# EAGLE design cpu2-a (EAGLE 9.7.0)
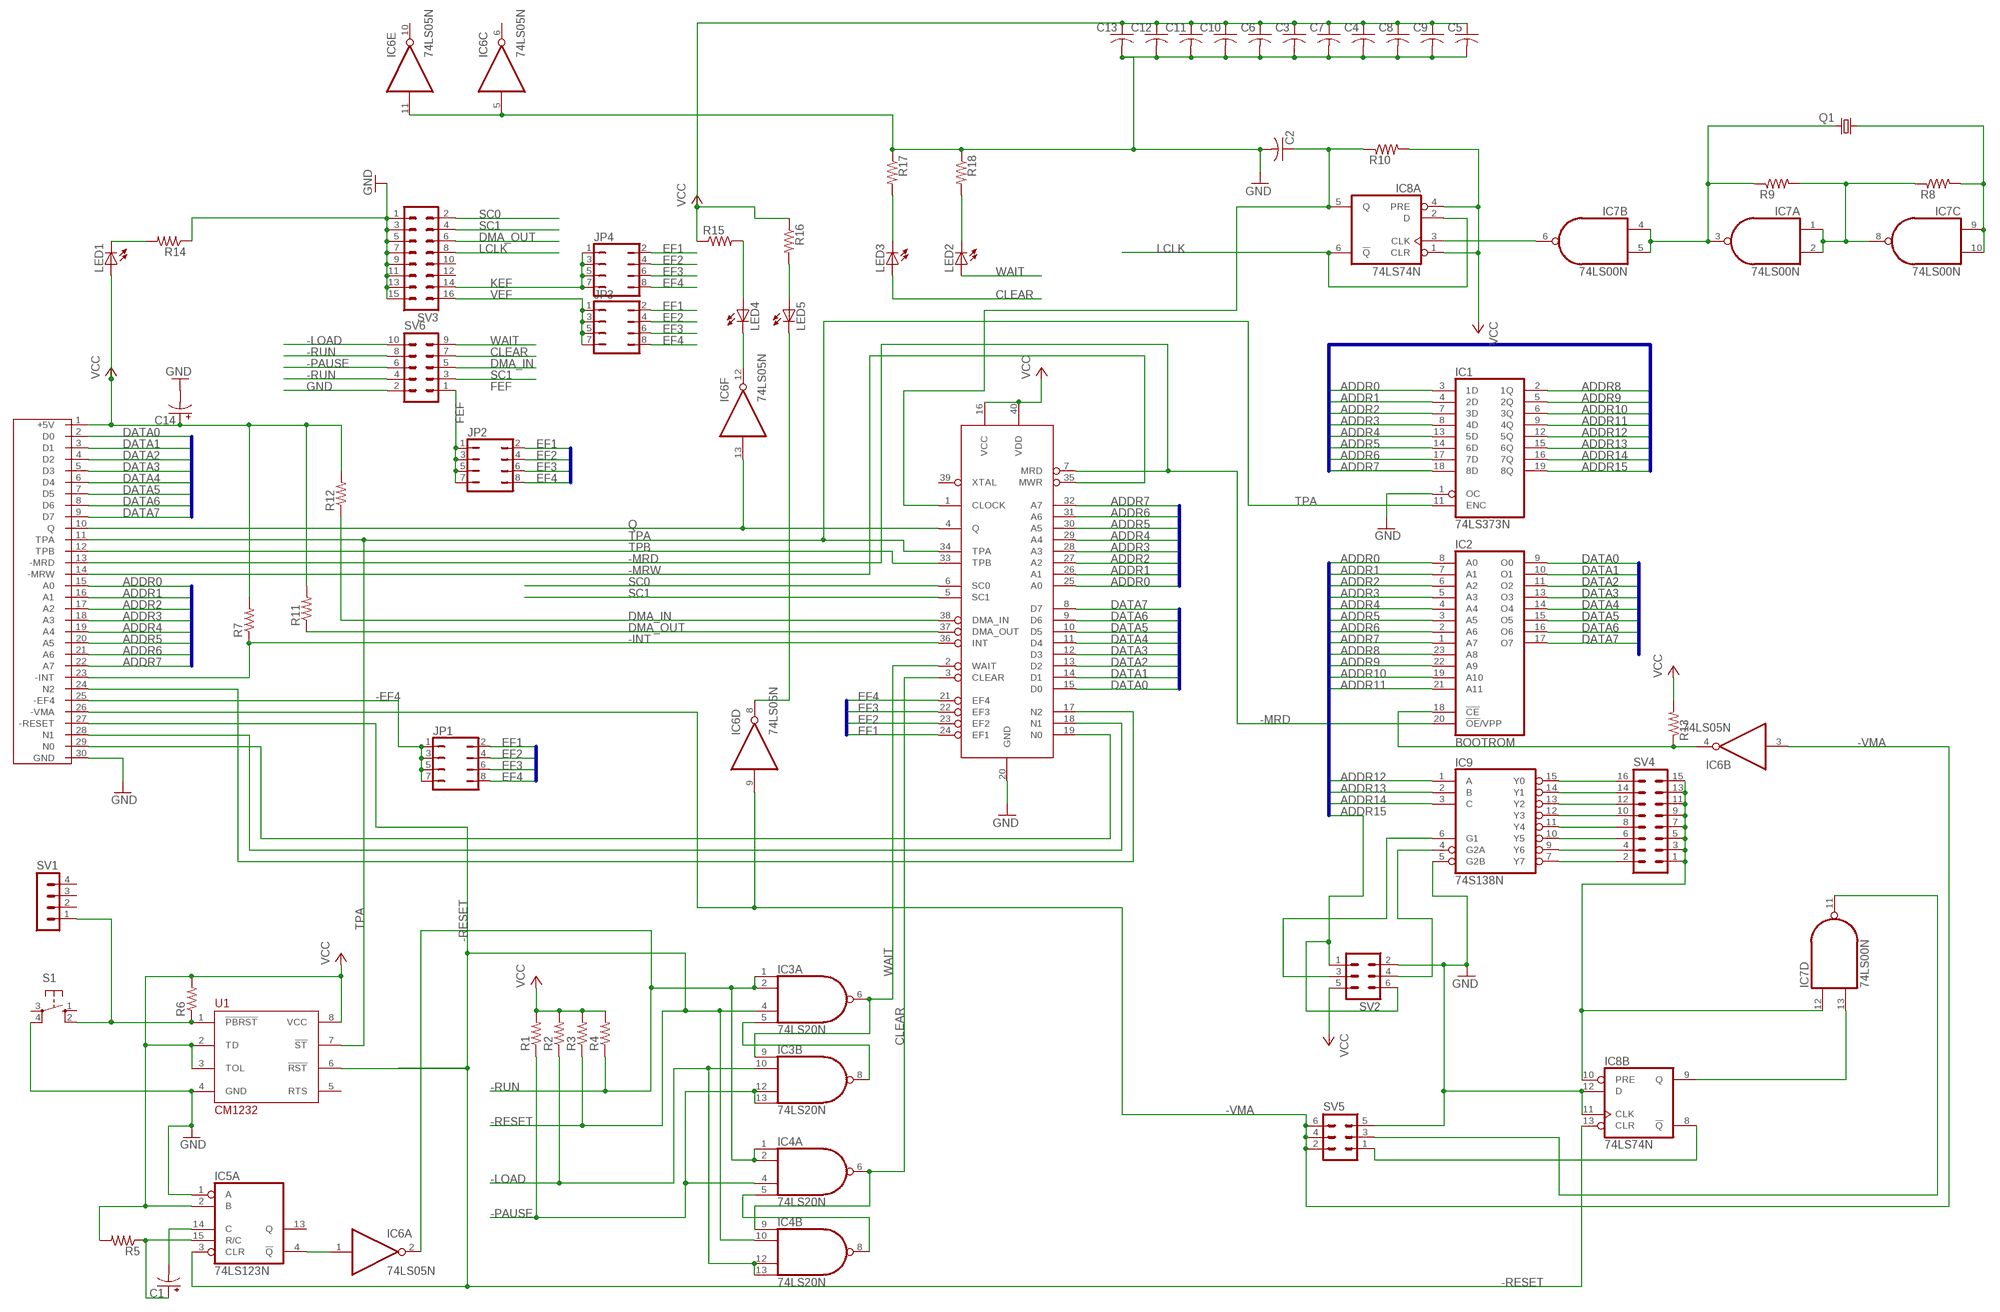
[diagram p0: schematic, sheet 1]

## Parts
C1  CPOL-USE2.5-7  [E2,5-7]
C2  C-US025-025X050  [C025-025X050]
C3  C-US025-050X050  [C025-050X050]
C4  C-US025-050X050  [C025-050X050]
C5  C-US025-050X050  [C025-050X050]
C6  C-US025-050X050  [C025-050X050]
C7  C-US025-050X050  [C025-050X050]
C8  C-US025-050X050  [C025-050X050]
C9  C-US025-050X050  [C025-050X050]
C10  C-US025-050X050  [C025-050X050]
C11  C-US025-050X050  [C025-050X050]
C12  C-US025-050X050  [C025-050X050]
C13  C-US025-050X050  [C025-050X050]
C14  CPOL-USE2.5-7  [E2,5-7]
IC1  74LS373N  [DIL20]
IC2  BOOTROM  2732  [DIL24]
IC3  74LS20N  [DIL14]
IC4  74LS20N  [DIL14]
IC5  74LS123N  [DIL16]
IC6  74LS05N  [DIL14]
IC7  74LS00N  [DIL14]
IC8  74LS74N  [DIL14]
IC9  74S138N  [DIL16]
JP1  JP4Q  [JP4Q]
JP2  JP4Q  [JP4Q]
JP3  JP4Q  [JP4Q]
JP4  JP4Q  [JP4Q]
LED1  LED5MM  [LED5MM]
LED2  LED5MM  [LED5MM]
LED3  LED5MM  [LED5MM]
LED4  LED5MM  [LED5MM]
LED5  LED5MM  [LED5MM]
Q1  CRYTALHC49U70  [HC49U70]
R1  R-US_0207/2V  [0207/2V]
R2  R-US_0207/2V  [0207/2V]
R3  R-US_0207/2V  [0207/2V]
R4  R-US_0207/2V  [0207/2V]
R5  R-US_0207/2V  [0207/2V]
R6  R-US_0207/2V  [0207/2V]
R7  R-US_0207/2V  [0207/2V]
R8  R-US_0207/2V  [0207/2V]
R9  R-US_0207/2V  [0207/2V]
R10  R-US_0207/2V  [0207/2V]
R11  R-US_0207/2V  [0207/2V]
R12  R-US_0207/2V  [0207/2V]
R13  R-US_0207/2V  [0207/2V]
R14  R-US_0207/7  [0207/7]
R15  R-US_0207/7  [0207/7]
R16  R-US_0207/7  [0207/7]
R17  R-US_0207/7  [0207/7]
R18  R-US_0207/7  [0207/7]
S1  10-XX  [B3F-10XX]
SV1  MA04-1  [MA04-1]
SV2  MA03-2  [MA03-2]
SV3  MA08-2  [MA08-2]
SV4  MA08-2  [MA08-2]
SV5  MA03-2  [MA03-2]
SV6  MA05-2  [MA05-2]
U1  CM1232  [DIP-8]
U$1  CDP1802BCECDP1802BCE  [DIL40]
U$2  C30  [C30]

## Nets
-EF4: JP1.1 JP1.3 JP1.5 JP1.7 U$2.25(-EF4)
-INT: R7.1 U$1.36(INT) U$2.23(-INT)
-LOAD: IC3.10(B:I1) IC4.12(B:I2) IC4.13(B:I3) R2.1 SV6.10
-MRD: IC2.20(!OE!/VPP) U$1.7(MRD) U$2.13(-MRD)
-MRW: U$1.35(MWR) U$2.14(-MRW)
-PAUSE: IC3.12(B:I2) IC3.13(B:I3) IC4.4(A:I2) R1.1 SV6.6
-RESET: IC3.4(A:I2) IC4.10(B:I1) IC5.3(A:CLR) IC8.13(B:CLR) R3.1 U1.6(!RST) U$2.27(-RESET)
-RUN: IC3.1(A:I0) IC3.2(A:I1) IC4.1(A:I0) IC4.2(A:I1) IC6.2(A:O) R4.1 SV6.4 SV6.8
-VMA: IC6.3(B:I) IC6.9(D:I) SV5.2 SV5.4 SV5.6 U$2.26(-VMA)
ADDR0: IC1.3(1D) IC2.8(A0) U$1.25(A0) U$2.15(A0)
ADDR1: IC1.4(2D) IC2.7(A1) U$1.26(A1) U$2.16(A1)
ADDR2: IC1.7(3D) IC2.6(A2) U$1.27(A2) U$2.17(A2)
ADDR3: IC1.8(4D) IC2.5(A3) U$1.28(A3) U$2.18(A3)
ADDR4: IC1.13(5D) IC2.4(A4) U$1.29(A4) U$2.19(A4)
ADDR5: IC1.14(6D) IC2.3(A5) U$1.30(A5) U$2.20(A5)
ADDR6: IC1.17(7D) IC2.2(A6) U$1.31(A6) U$2.21(A6)
ADDR7: IC1.18(8D) IC2.1(A7) U$1.32(A7) U$2.22(A7)
ADDR8: IC1.2(1Q) IC2.23(A8)
ADDR9: IC1.5(2Q) IC2.22(A9)
ADDR10: IC1.6(3Q) IC2.19(A10)
ADDR11: IC1.9(4Q) IC2.21(A11)
ADDR12: IC1.12(5Q) IC9.1(A)
ADDR13: IC1.15(6Q) IC9.2(B)
ADDR14: IC1.16(7Q) IC9.3(C)
ADDR15: IC1.19(8Q) SV2.1 SV2.6
CLEAR: IC4.6(A:O) IC4.9(B:I0) LED3.A SV6.7 U$1.3(CLEAR)
DATA0: IC2.9(O0) U$1.15(D0) U$2.2(D0)
DATA1: IC2.10(O1) U$1.14(D1) U$2.3(D1)
DATA2: IC2.11(O2) U$1.13(D2) U$2.4(D2)
DATA3: IC2.13(O3) U$1.12(D3) U$2.5(D3)
DATA4: IC2.14(O4) U$1.11(D4) U$2.6(D4)
DATA5: IC2.15(O5) U$1.10(D5) U$2.7(D5)
DATA6: IC2.16(O6) U$1.9(D6) U$2.8(D6)
DATA7: IC2.17(O7) U$1.8(D7) U$2.9(D7)
DMA_IN: R12.1 SV6.5 U$1.38(DMA_IN)
DMA_OUT: R11.1 SV3.6 U$1.37(DMA_OUT)
EF1: JP1.2 JP2.2 JP3.2 JP4.2 U$1.24(EF1)
EF2: JP1.4 JP2.4 JP3.4 JP4.4 U$1.23(EF2)
EF3: JP1.6 JP2.6 JP3.6 JP4.6 U$1.22(EF3)
EF4: JP1.8 JP2.8 JP3.8 JP4.8 U$1.21(EF4)
FEF: JP2.1 JP2.3 JP2.5 JP2.7 SV6.1
GND: C2.2 C3.2 C4.2 C5.2 C6.2 C7.2 C8.2 C9.2 C10.2 C11.2 C12.2 C13.2 C14.- IC1.1(OC) IC5.1(A:A) IC6.5(C:I) IC6.11(E:I) IC8.11(B:CLK) IC8.12(B:D) IC9.5(G2B) R14.1 R17.1 R18.1 S1.4(P1) SV2.2 SV3.1 SV3.3 SV3.5 SV3.7 SV3.9 SV3.11 SV3.13 SV3.15 SV5.5 SV6.2 U1.4(GND) U$1.20(GND) U$2.30(GND)
KEF: JP4.1 JP4.3 JP4.5 JP4.7 SV3.14
LCLK: IC8.2(A:D) IC8.6(A:!Q) SV3.8
N0: U$1.19(N0) U$2.29(N0)
N1: U$1.18(N1) U$2.28(N1)
N2: U$1.17(N2) U$2.24(N2)
N$1: IC7.11(D:O) SV5.3
N$2: R6.1 S1.2(S1) SV1.1 U1.1(!PBRST)
N$3: IC2.18(!CE) IC6.4(B:O) R13.1
N$4: IC7.13(D:I1) IC8.9(B:Q)
N$5: LED1.K(C) R14.2
N$6: IC8.8(B:!Q) SV5.1
N$7: IC6.12(F:O) LED4.K(C)
N$8: LED4.A R15.2
N$9: LED3.K(C) R17.2
N$10: LED2.K(C) R18.2
N$13: LED5.A R16.2
N$15: IC5.4(A:!Q) IC6.1(A:I)
N$16: IC7.1(A:I0) IC7.2(A:I1) IC7.8(C:O) R8.1 R9.2
N$17: C1.+ IC5.15(A:R/C) R5.1
N$18: IC7.3(A:O) IC7.4(B:I0) IC7.5(B:I1) Q1.2 R9.1
N$19: C1.- IC5.14(A:C)
N$20: IC9.4(G2A) SV2.4
N$21: IC7.9(C:I0) IC7.10(C:I1) Q1.1 R8.2
N$22: IC3.5(A:I3) IC3.8(B:O)
N$23: IC7.6(B:O) IC8.3(A:CLK)
N$24: IC4.5(A:I3) IC4.8(B:O)
N$25: IC6.8(D:O) LED5.K(C)
N$27: C2.1 IC8.5(A:Q) R10.1 U$1.1(CLOCK)
N$29: IC9.15(Y0) SV4.16
N$30: IC9.14(Y1) SV4.14
N$31: IC9.13(Y2) SV4.12
N$32: IC9.12(Y3) SV4.10
N$33: IC9.11(Y4) SV4.8
N$34: IC9.10(Y5) SV4.6
N$35: IC9.9(Y6) SV4.4
N$36: IC9.7(Y7) SV4.2
N$37: IC7.12(D:I0) IC8.10(B:PRE) SV4.1 SV4.3 SV4.5 SV4.7 SV4.9 SV4.11 SV4.13 SV4.15
N$38: IC9.6(G1) SV2.3
Q: IC6.13(F:I) U$1.4(Q) U$2.10(Q)
SC0: SV3.2 U$1.6(SC0)
SC1: SV3.4 SV6.3 U$1.5(SC1)
TPA: IC1.11(ENC) U1.7(!ST) U$1.34(TPA) U$2.11(TPA)
TPB: U$1.33(TPB) U$2.12(TPB)
VCC: C3.1 C4.1 C5.1 C6.1 C7.1 C8.1 C9.1 C10.1 C11.1 C12.1 C13.1 C14.+ IC5.2(A:B) IC8.1(A:CLR) IC8.4(A:PRE) LED1.A R1.2 R2.2 R3.2 R4.2 R5.2 R6.2 R7.2 R10.2 R11.2 R12.2 R13.2 R15.1 R16.1 SV2.5 U1.2(TD) U1.3(TOL) U1.8(VCC) U$1.16(VCC) U$1.40(VDD) U$2.1(+5V)
VEF: JP3.1 JP3.3 JP3.5 JP3.7 SV3.16
WAIT: IC3.6(A:O) IC3.9(B:I0) LED2.A SV6.9 U$1.2(WAIT)
Unconnected: IC5.5(B:Q) IC5.6(B:C) IC5.7(B:R/C) IC5.9(B:A) IC5.10(B:B) IC5.11(B:CLR) IC5.12(B:!Q) IC5.13(A:Q) IC6.6(C:O) IC6.10(E:O) S1.1(S) S1.3(P) SV1.2 SV1.3 SV1.4 SV3.10 SV3.12 U1.5(RTS) U$1.39(XTAL)

## Buses
DATA[0..7]
ADDR[0..15]
EF[1..4]

## Power pins joined to a net without a drawn wire
GND: IC1.10(GND) IC2.12(GND) IC3.7(P:GND) IC4.7(P:GND) IC5.8(P:GND) IC6.7(P:GND) IC7.7(P:GND) IC8.7(P:GND) IC9.8(GND)
VCC: IC1.20(VCC) IC2.24(VCC) IC3.14(P:VCC) IC4.14(P:VCC) IC5.16(P:VCC) IC6.14(P:VCC) IC7.14(P:VCC) IC8.14(P:VCC) IC9.16(VCC)

## Library data of the parts
C1 C14 = rcl:CPOL-US: POLARIZED CAPACITOR, American symbol
C2-C13 = rcl:C-US: CAPACITOR, American symbol
IC1 = 74xx-us:74*373: Octal D type transparent LATCH, edge triggered
IC2 = memory:2732: MEMORY
IC3 IC4 = 74xx-us:74*20: Dual 4-input NAND gate
IC5 = 74xx-us:74*123: Retriggerable monostable MULTIVIBRATOR
IC6 = 74xx-us:74*05: Hex INVERTER, open collector
IC7 = 74xx-us:74*00: Quad 2-input NAND gate
IC8 = 74xx-us:74*74: Dual D type positive edge triggered FLIP FLOP, preset and clear
IC9 = 74xx-us:74*138: 3-line to 8-line DECODER/DEMULTIPLEXER
JP1-JP4 = jumper:JP4Q: JUMPER
LED1-LED5 = led:LED: LED OSRAM: - CHIPLED LG R971, LG N971, LY N971, LG Q971, LY Q971, LO R971, LY R971 LH N974, LH R974 LS Q976, LO Q976, LY Q976 LO Q996 - Hyper CHIPLED LW Q18S LB Q993, LB Q99A, LB R99A - SideLED LS A670, LO A670, LY A670, LG A670, LP A670 LB A673, LV A673, LT A673, LW A673 LH A674 LY A675 LS A676, LA A676, LO A676, LY A676, LW A676 LS A679, LY A679, LG A679 - Hyper Micro SIDELED® LS Y876, LA Y876, LO Y876, LY Y876 LT Y87S - SmartLED LW L88C, LW L88S LB L89C, LB L89S, LG L890 LS L89K, LO L89K, LY L89K LS L896, LA L896, LO L896, LY L896 - TOPLED LS T670, LO T670, LY T670, LG T670, LP T670 LSG T670, LSP T670, LSY T670, LOP T670, LYG T670 LG T671, LOG T671, LSG T671 LB T673, LV T673, LT T673, LW T673 LH T674 LS T676, LA T676, LO T676, LY T676, LB T676, LH T676, LSB T676, LW T676 LB T67C, LV T67C, LT T67C, LS T67K, LO T67K, LY T67K, LW E67C LS E67B, LA E67B, LO E67B, LY E67B, LB E67C, LV E67C, LT E67C LW T67C LS T679, LY T679, LG T679 LS T770, LO T770, LY T770, LG T770, LP T770 LB T773, LV T773, LT T773, LW T773 LH T774 LS E675, LA E675, LY E675, LS T675 LS T776, LA T776, LO T776, LY T776, LB T776 LHGB T686 LT T68C, LB T68C - Hyper Mini TOPLED® LB M676 - Mini TOPLED Santana® LG M470 LS M47K, LO M47K, LY M47K Source: http://www.osram.convergy.de/
Q1 = crystal:CRYTAL: CRYSTAL
R1-R18 = rcl:R-US_: RESISTOR, American symbol
S1 = switch-omron:10-XX: OMRON SWITCH
SV1 = con-lstb:MA04-1: PIN HEADER
SV2 SV5 = con-lstb:MA03-2: PIN HEADER
SV3 SV4 = con-lstb:MA08-2: PIN HEADER
SV6 = con-lstb:MA05-2: PIN HEADER
U1 = 65xxx:CM1232: CM1232 CMOS Microprocessor Monitor
U$1 = cdp:CDP1802BCE
U$2 = k1:C30

## Board
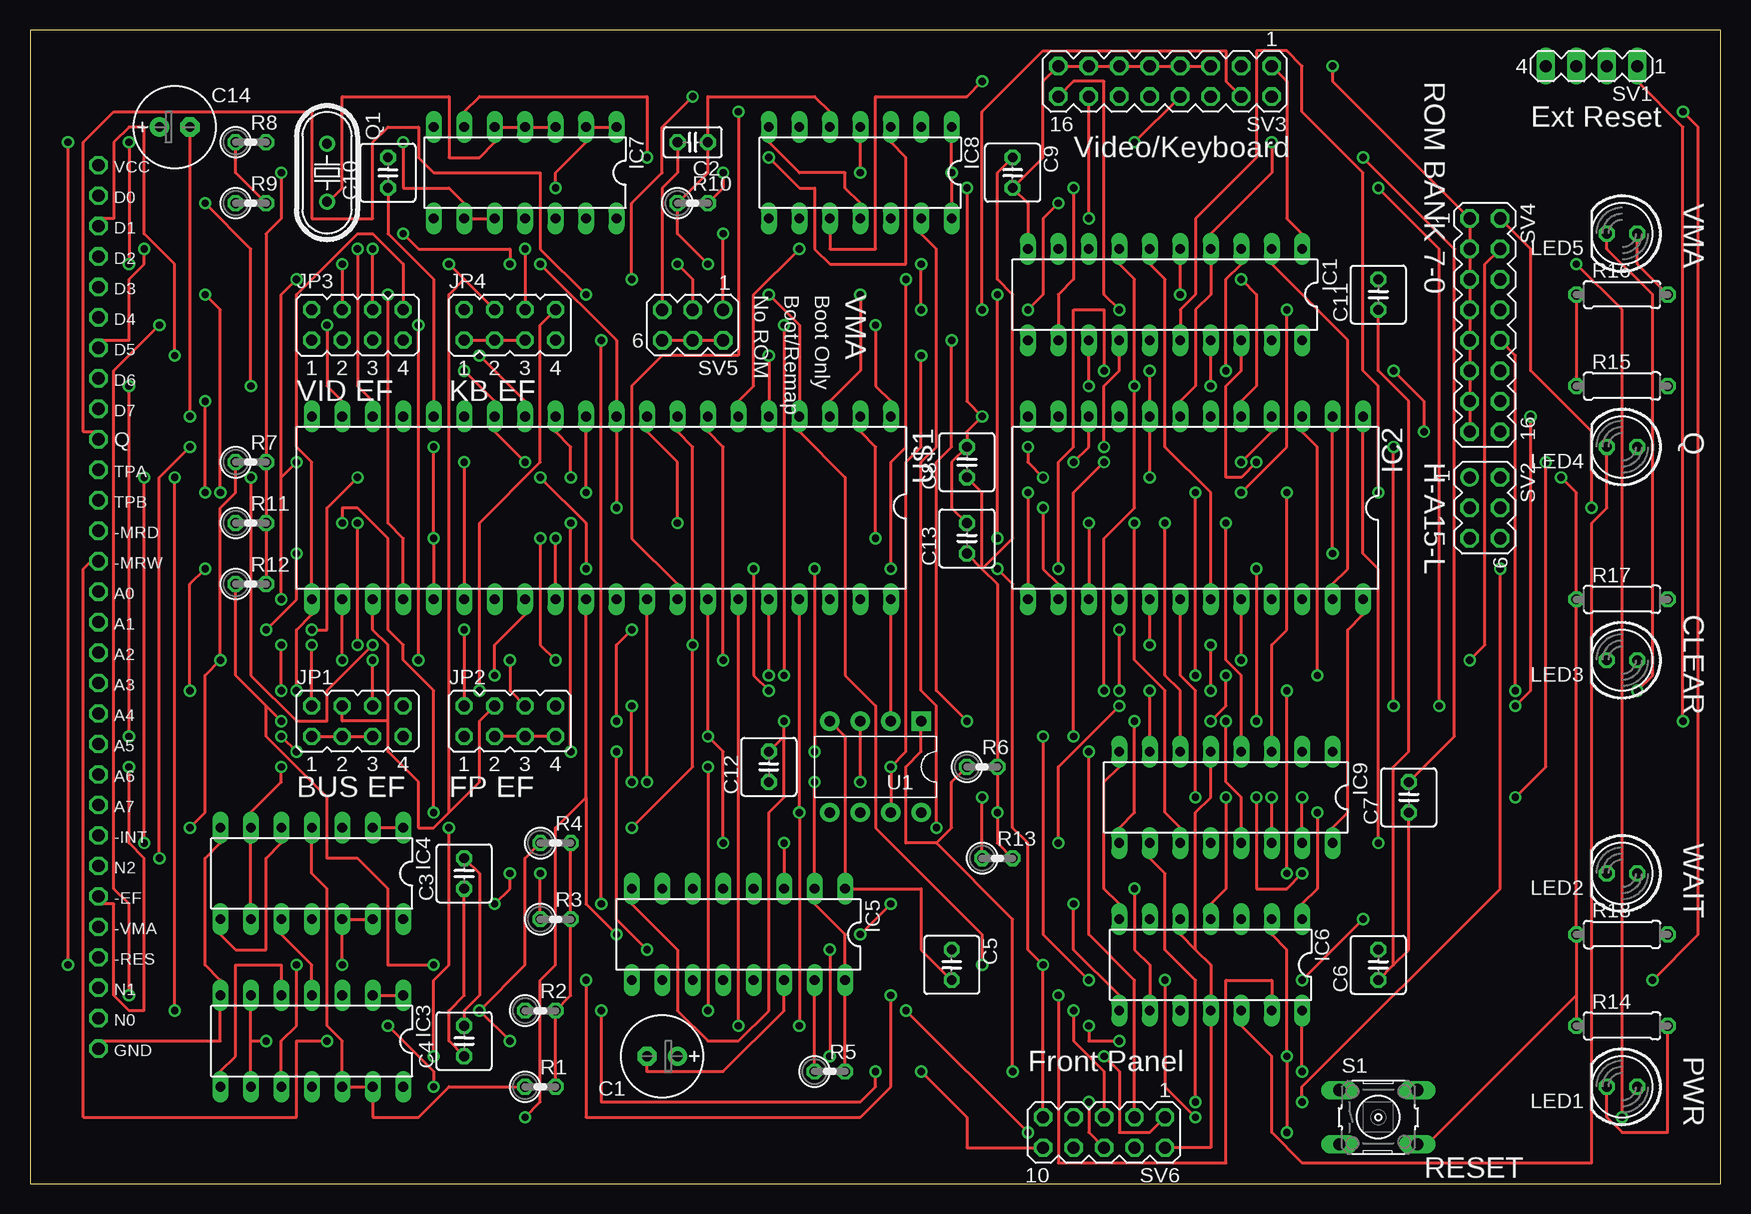
[diagram p1: board, top side]
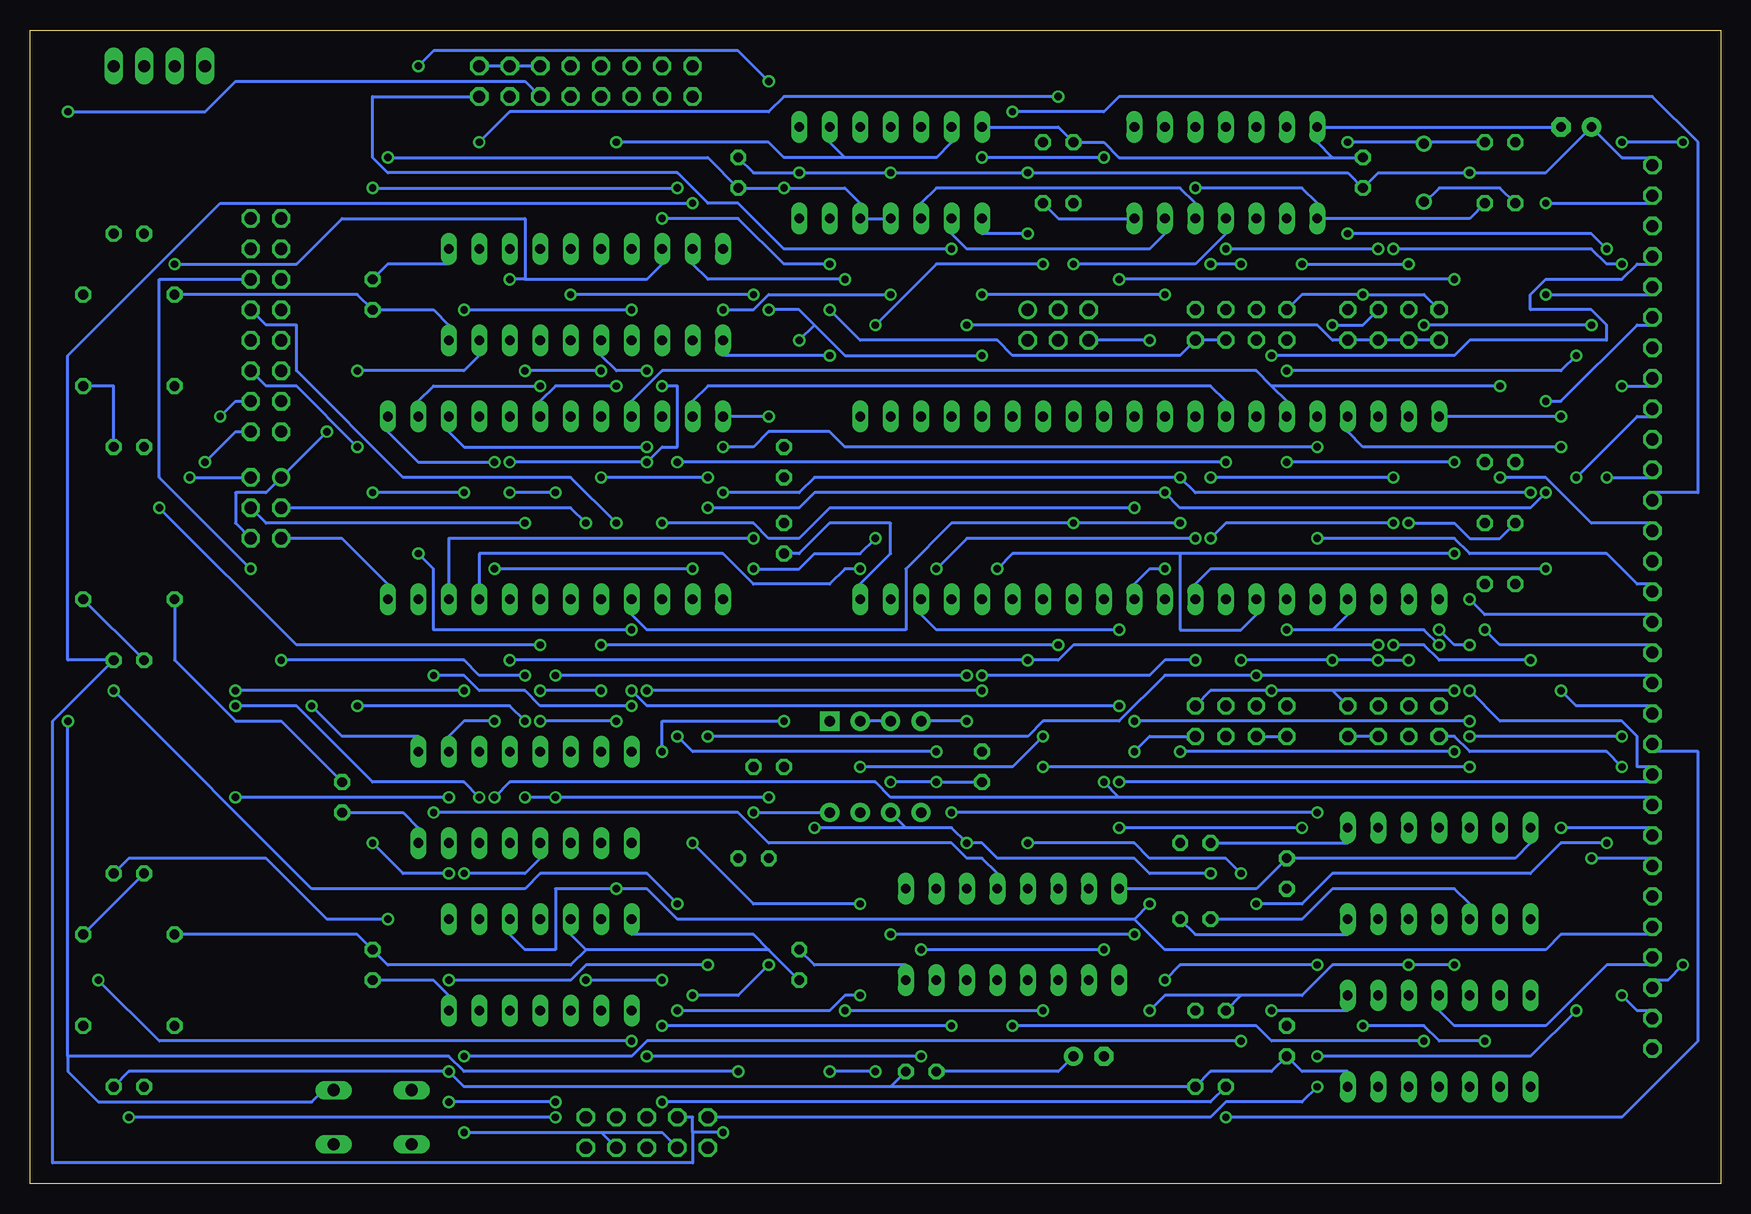
[diagram p2: board, bottom side, seen from below]

Size 140.95 x 96.19 mm. Coordinates in mm from the lower left corner, seen from the top.
Outline: 0,0 140.95,0 140.95,96.19 0,96.19 0,0
Copper layers (1*16): Top / Bottom
Stack-up Default Layer Stack: Top User Defined 0.035mm / Dielectric-1 User Defined 1.5mm / Bottom User Defined 0.035mm
Design rules: minimum drill size 24mil, minimum copper width 10mil, keepout clearance 0mil, drill distance 8mil, via restrict clearance 0mil, dimension clearance 40mil, restrict clearance 0mil, copper clearance wire_polygon to wire_polygon 8mil, copper clearance wire_polygon to pad_smd 8mil, copper clearance wire_polygon to via 8mil, copper clearance pad_smd to pad_smd 8mil, copper clearance pad_smd to via 8mil, copper clearance via to via 8mil, copper clearance smd to pad (same net) 8mil, copper clearance smd to via (same net) 8mil, copper clearance smd to smd (same net) 8mil
RestrictCopper: area 0.6,0.5 to 76.8,4.3; area 0.6,91.9 to 76.8,95.7

### Footprints (pad centres in the part's own frame; a part is rotated, then mirrored left to right if it is on the bottom)
E2,5-7 = drill 0.813 pad 1.6: + -1.27,0 | drill 0.813 pad 1.6 octagon: - 1.27,0
C025-025X050 = drill 0.813 octagon: 1 -1.27,0; 2 1.27,0
C025-050X050 = drill 0.813 octagon: 1 -1.27,0; 2 1.27,0
DIL20 = drill 0.813 long: 1 -11.43,-3.81; 2 -8.89,-3.81; 3 -6.35,-3.81; 4 -3.81,-3.81; 5 -1.27,-3.81; 6 1.27,-3.81; 7 3.81,-3.81; 8 6.35,-3.81; 9 8.89,-3.81; 10 11.43,-3.81; 11 11.43,3.81; 12 8.89,3.81; 13 6.35,3.81; 14 3.81,3.81; 15 1.27,3.81; 16 -1.27,3.81; 17 -3.81,3.81; 18 -6.35,3.81; 19 -8.89,3.81; 20 -11.43,3.81
DIL24 = drill 0.813 long: 1 -13.97,-7.62; 2 -11.43,-7.62; 3 -8.89,-7.62; 4 -6.35,-7.62; 5 -3.81,-7.62; 6 -1.27,-7.62; 7 1.27,-7.62; 8 3.81,-7.62; 9 6.35,-7.62; 10 8.89,-7.62; 11 11.43,-7.62; 12 13.97,-7.62; 13 13.97,7.62; 14 11.43,7.62; 15 8.89,7.62; 16 6.35,7.62; 17 3.81,7.62; 18 1.27,7.62; 19 -1.27,7.62; 20 -3.81,7.62; 21 -6.35,7.62; 22 -8.89,7.62; 23 -11.43,7.62; 24 -13.97,7.62
DIL14 = drill 0.813 long: 1 -7.62,-3.81; 2 -5.08,-3.81; 3 -2.54,-3.81; 4 0,-3.81; 5 2.54,-3.81; 6 5.08,-3.81; 7 7.62,-3.81; 8 7.62,3.81; 9 5.08,3.81; 10 2.54,3.81; 11 0,3.81; 12 -2.54,3.81; 13 -5.08,3.81; 14 -7.62,3.81
DIL16 = drill 0.813 long: 1 -8.89,-3.81; 2 -6.35,-3.81; 3 -3.81,-3.81; 4 -1.27,-3.81; 5 1.27,-3.81; 6 3.81,-3.81; 7 6.35,-3.81; 8 8.89,-3.81; 9 8.89,3.81; 10 6.35,3.81; 11 3.81,3.81; 12 1.27,3.81; 13 -1.27,3.81; 14 -3.81,3.81; 15 -6.35,3.81; 16 -8.89,3.81
JP4Q = drill 0.914 octagon: 1 -3.81,-1.27; 2 -3.81,1.27; 3 -1.27,-1.27; 4 -1.27,1.27; 5 1.27,-1.27; 6 1.27,1.27; 7 3.81,-1.27; 8 3.81,1.27
LED5MM = drill 0.813 octagon: A -1.27,0; K 1.27,0
HC49U70 = drill 0.813: 1 -2.413,0; 2 2.413,0
0207/2V = drill 0.813 octagon: 1 -1.27,0; 2 1.27,0
0207/7 = drill 0.813 octagon: 1 -3.81,0; 2 3.81,0
B3F-10XX = drill 1.016 long: 1 -3.251,2.261; 2 3.251,2.261; 3 -3.251,-2.261; 4 3.251,-2.261
MA04-1 = drill 1.016 long: 1 -3.81,0; 2 -1.27,0; 3 1.27,0; 4 3.81,0
MA03-2 = drill 1.016: 1 -2.54,-1.27 | drill 1.016 octagon: 2 -2.54,1.27; 3 0,-1.27; 4 0,1.27; 5 2.54,-1.27; 6 2.54,1.27
MA08-2 = drill 1.016 octagon: 1 -8.89,-1.27; 2 -8.89,1.27; 3 -6.35,-1.27; 4 -6.35,1.27; 5 -3.81,-1.27; 6 -3.81,1.27; 7 -1.27,-1.27; 8 -1.27,1.27; 9 1.27,-1.27; 10 1.27,1.27; 11 3.81,-1.27; 12 3.81,1.27; 13 6.35,-1.27; 14 6.35,1.27; 15 8.89,-1.27; 16 8.89,1.27
MA05-2 = drill 1.016 octagon: 1 -5.08,-1.27; 2 -5.08,1.27; 3 -2.54,-1.27; 4 -2.54,1.27; 5 0,-1.27; 6 0,1.27; 7 2.54,-1.27; 8 2.54,1.27; 9 5.08,-1.27; 10 5.08,1.27
DIP-8 = drill 0.889 pad 1.6 square: 1 -2.54,-2.54 | drill 0.889 pad 1.6: 2 0,-2.54; 3 2.54,-2.54; 4 5.08,-2.54; 5 5.08,5.08; 6 2.54,5.08; 7 0,5.08; 8 -2.54,5.08
DIL40 = drill 0.813 long: 1 -24.13,-7.62; 2 -21.59,-7.62; 3 -19.05,-7.62; 4 -16.51,-7.62; 5 -13.97,-7.62; 6 -11.43,-7.62; 7 -8.89,-7.62; 8 -6.35,-7.62; 9 -3.81,-7.62; 10 -1.27,-7.62; 11 1.27,-7.62; 12 3.81,-7.62; 13 6.35,-7.62; 14 8.89,-7.62; 15 11.43,-7.62; 16 13.97,-7.62; 17 16.51,-7.62; 18 19.05,-7.62; 19 21.59,-7.62; 20 24.13,-7.62; 21 24.13,7.62; 22 21.59,7.62; 23 19.05,7.62; 24 16.51,7.62; 25 13.97,7.62; 26 11.43,7.62; 27 8.89,7.62; 28 6.35,7.62; 29 3.81,7.62; 30 1.27,7.62; 31 -1.27,7.62; 32 -3.81,7.62; 33 -6.35,7.62; 34 -8.89,7.62; 35 -11.43,7.62; 36 -13.97,7.62; 37 -16.51,7.62; 38 -19.05,7.62; 39 -21.59,7.62; 40 -24.13,7.62
C30 = drill 1.016 octagon: 1 -36.83,0; 2 -34.29,0; 3 -31.75,0; 4 -29.21,0; 5 -26.67,0; 6 -24.13,0; 7 -21.59,0; 8 -19.05,0; 9 -16.51,0; 10 -13.97,0; 11 -11.43,0; 12 -8.89,0; 13 -6.35,0; 14 -3.81,0; 15 -1.27,0; 16 1.27,0; 17 3.81,0; 18 6.35,0; 19 8.89,0; 20 11.43,0; 21 13.97,0; 22 16.51,0; 23 19.05,0; 24 21.59,0; 25 24.13,0; 26 26.67,0; 27 29.21,0; 28 31.75,0; 29 34.29,0; 30 36.83,0

### Placement (x,y rotation side)
C1  52.7,10.63 180 top
C2  55.24,86.83 180 top
C3  36.19,25.87 90 top
C4  36.19,11.9 90 top
C5  76.83,18.25 270 top
C6  112.39,18.25 90 top
C7  114.93,32.22 90 top
C8  78.1,60.16 90 top
C9  81.91,84.29 270 top
C10  29.84,84.29 90 top
C11  112.39,74.13 90 top
C12  61.59,34.76 90 top
C13  78.1,53.81 90 top
C14  12.06,88.1 0 top
IC1  94.61,74.13 180 top
IC2  97.15,56.35 180 top
IC3  23.49,11.9 180 top
IC4  23.49,25.87 180 top
IC5  59.05,20.79 180 top
IC6  98.42,18.25 180 top
IC7  41.27,84.29 180 top
IC8  69.21,84.29 180 top
IC9  99.69,32.22 180 top
JP1  27.3,38.57 0 top
JP2  40,38.57 0 top
JP3  27.3,71.59 0 top
JP4  40,71.59 0 top
LED1  132.71,8.09 180 top
LED2  132.71,25.87 180 top
LED3  132.71,43.65 180 top
LED4  132.71,61.43 180 top
LED5  132.71,79.21 180 top
Q1  24.76,84.29 270 top
R1  42.54,8.09 0 top
R2  42.54,14.44 0 top
R3  43.81,22.06 0 top
R4  43.81,28.41 0 top
R5  66.67,9.36 0 top
R6  79.37,34.76 0 top
R7  18.41,60.16 0 top
R8  18.41,86.83 0 top
R9  18.41,81.75 0 top
R10  55.24,81.75 0 top
R11  18.41,55.08 0 top
R12  18.41,50 0 top
R13  80.64,27.14 0 top
R14  132.71,13.17 0 top
R15  132.71,66.51 0 top
R16  132.71,74.13 0 top
R17  132.71,48.73 0 top
R18  132.71,20.79 0 top
S1  112.39,5.55 0 top
SV1  130.17,93.18 180 top
SV2  121.28,56.35 270 top
SV3  94.61,91.91 180 top
SV4  121.28,71.59 270 top
SV5  55.24,71.59 180 top
SV6  89.53,4.28 180 top
U1  71.75,36.03 180 top
U$1  47.62,56.35 180 top
U$2  5.71,48.09 270 top

### Tracks (layer width: path | path; a pad name or v marks a point on that pad's centre or on a via)
-EF4  (via drill 0.61)
  Top 0.254: JP1.1 JP1.3 JP1.5 | v8.25,34.76 8.25,28.41 9.52,27.14 9.52,14.44 8.25,14.44 6.98,15.71 6.98,23.33 5.71,23.33 U$2.25
  Bottom 0.254: JP1.5 JP1.7 | v8.25,34.76 9.52,36.03 20.95,36.03 22.22,37.3 JP1.1
-INT  (via drill 0.61)
  Top 0.254: v43.81,43.65 42.54,44.92 v42.54,53.81 | v27.3,44.92 v27.3,55.08 | R7.1 17.14,57.62 15.87,56.35 v15.87,43.65 14.6,42.38 14.6,30.95 v13.33,29.68 | v61.59,42.38 U$1.36
  Bottom 0.254: v61.59,42.38 47.62,42.38 46.35,43.65 v43.81,43.65 | v42.54,53.81 41.27,55.08 v27.3,55.08 | v27.3,44.92 24.76,44.92 23.49,43.65 v15.87,43.65 | v13.33,29.68 5.71,29.68 U$2.23
-LOAD  (via drill 0.61)
  Top 0.254: IC4.13 IC4.12 v26.03,18.25 | v22.22,18.25 22.22,13.17 20.95,11.9 IC3.10 | SV6.10 78.1,3.01 78.1,5.55 v74.29,9.36 | v70.48,9.36 70.48,8.09 69.21,6.82 47.62,6.82 v47.62,14.44
  Bottom 0.254: v22.22,18.25 v26.03,18.25 32.38,18.25 34.92,15.71 40,15.71 | 40,15.71 R2.1 | v70.48,9.36 v74.29,9.36 | v47.62,14.44 46.35,15.71 40,15.71
-MRD  (via drill 0.61)
  Top 0.254: v57.78,43.65 57.78,61.43 56.51,62.7 U$1.7 | v100.96,43.65 IC2.20 | v18.41,58.89 18.41,42.38 22.22,38.57 24.76,38.57 24.76,41.11 v28.57,44.92
  Bottom 0.254: v100.96,43.65 v57.78,43.65 55.24,43.65 53.97,44.92 v28.57,44.92 | v18.41,58.89 14.6,58.89 10.79,55.08 5.71,55.08 U$2.13
-MRW  (via drill 0.61)
  Top 0.254: v24.76,11.9 22.22,11.9 22.22,5.55 4.44,5.55 4.44,51.27 5.71,52.54 U$2.14 | v59.05,13.17 U$1.35
  Bottom 0.254: v59.05,13.17 38.73,13.17 37.46,11.9 v24.76,11.9
-PAUSE  (via drill 0.61)
  Top 0.254: R1.1 34.92,8.09 32.38,5.55 28.57,5.55 IC3.13 IC3.12 26.03,11.9 24.76,13.17 24.76,24.6 23.49,25.87 IC4.4 | SV6.6 88.26,4.28 v88.26,6.82
  Bottom 0.254: v88.26,6.82 42.54,6.82 R1.1
-RESET  (via drill 0.61)
  Top 0.254: IC3.4 23.49,18.25 20.95,20.79 IC4.10 | v62.86,28.41 IC5.3 | v75.56,29.68 75.56,39.84 74.29,41.11 74.29,60.16 75.56,61.43 75.56,77.94 74.29,79.21 IC8.13 | R3.1 v42.54,25.87
  Bottom 0.254: R3.1 34.92,22.06 32.38,24.6 22.22,24.6 20.95,23.33 IC4.10 | U$2.27 5.71,18.25 9.52,18.25 14.6,13.17 22.22,13.17 23.49,14.44 IC3.4 | 67.94,29.68 64.13,29.68 v62.86,28.41 61.59,28.41 60.32,27.14 48.89,27.14 47.62,25.87 v42.54,25.87 | 67.94,29.68 U1.6 | 67.94,29.68 v75.56,29.68
-RUN  (via drill 0.61)
  Top 0.254: IC3.2 IC3.1 | IC4.1 IC4.2 | R4.1 41.27,27.14 41.27,18.25 v37.46,14.44 v40,11.9 | v104.77,4.28 v104.77,10.63 104.77,19.52 103.5,20.79 IC6.2
  Bottom 0.254: R4.1 31.11,28.41 IC4.1 | v37.46,14.44 31.11,14.44 IC3.1 | v104.77,4.28 93.34,4.28 | 93.34,4.28 SV6.4 | SV6.8 88.26,4.28 93.34,4.28 | v40,11.9 89.53,11.9 90.8,10.63 v104.77,10.63
-VMA  (via drill 0.61)
  Top 0.254: SV5.6 SV5.4 SV5.2 | v92.07,24.6 92.07,19.52 93.34,18.25 IC6.9 | v47.62,23.33 v47.62,70.32
  Bottom 0.254: IC6.3 100.96,20.79 99.69,19.52 97.15,19.52 97.15,24.6 v92.07,24.6 89.53,24.6 86.99,22.06 48.89,22.06 | 48.89,22.06 46.35,19.52 14.6,19.52 13.33,20.79 5.71,20.79 U$2.26 | v47.62,70.32 SV5.6 | 48.89,22.06 v47.62,23.33
ADDR0  (via drill 0.61)
  Top 0.254: v99.69,67.78 99.69,75.4 100.96,76.67 IC1.3 | v93.34,67.78 IC2.8 v93.34,58.89 | U$1.25 v33.65,53.81 v33.65,61.43 | v84.45,58.89 83.18,60.16 v83.18,61.43
  Bottom 0.254: v93.34,67.78 v99.69,67.78 | v33.65,53.81 22.22,53.81 20.95,52.54 9.52,52.54 6.98,50 5.71,50 U$2.15 | v84.45,58.89 v93.34,58.89 | v83.18,61.43 80.64,61.43 79.37,62.7 74.29,62.7 73.02,61.43 v33.65,61.43
ADDR1  (via drill 0.61)
  Top 0.254: IC2.7 95.88,65.24 97.15,66.51 97.15,72.86 98.42,74.13 IC1.4 98.42,79.21 103.5,84.29 v103.5,86.83 | 20.95,58.89 v22.22,60.16 | v20.95,48.73 20.95,58.89 | v36.19,60.16 U$1.26 | v55.24,90.64 52.7,88.1 52.7,84.29 50.16,81.75 v50.16,75.4 | v22.22,75.4 20.95,74.13 20.95,58.89
  Bottom 0.254: v22.22,60.16 v36.19,60.16 | v20.95,48.73 19.68,47.46 5.71,47.46 U$2.16 | v103.5,86.83 100.96,89.37 79.37,89.37 78.1,90.64 v55.24,90.64 | v22.22,75.4 v50.16,75.4
ADDR2  (via drill 0.61)
  Top 0.254: IC1.7 90.8,76.67 92.07,75.4 v92.07,66.51 92.07,56.35 89.53,53.81 v89.53,41.11 | v22.22,52.54 22.22,48.73 v19.68,46.19 | v61.59,41.11 60.32,42.38 v60.32,51.27
  Bottom 0.254: v92.07,66.51 97.15,66.51 98.42,65.24 IC2.6 | 45.08,52.54 45.08,46.19 40,46.19 38.73,47.46 U$1.27 | v22.22,52.54 45.08,52.54 | v19.68,46.19 18.41,44.92 5.71,44.92 U$2.17 | v61.59,41.11 v89.53,41.11 | v60.32,51.27 59.05,52.54 45.08,52.54
ADDR3  (via drill 0.61)
  Top 0.254: v100.96,75.4 102.23,74.13 102.23,66.51 100.96,65.24 IC2.5 | v38.73,42.38 38.73,44.92 41.27,47.46 U$1.28 | v128.9,76.67 132.71,72.86 v132.71,5.55 | v97.15,5.55 94.61,8.09 v94.61,16.98 | v88.26,16.98 84.45,20.79 v84.45,37.3
  Bottom 0.254: 99.69,75.4 v100.96,75.4 | 99.69,75.4 89.53,75.4 88.26,76.67 IC1.8 | U$2.18 5.71,42.38 v38.73,42.38 46.35,42.38 50.16,38.57 56.51,38.57 57.78,37.3 v84.45,37.3 | 99.69,75.4 99.69,80.48 114.93,80.48 118.74,76.67 v128.9,76.67 | v97.15,5.55 v132.71,5.55 | v88.26,16.98 v94.61,16.98
ADDR4  (via drill 0.61)
  Top 0.254: v100.96,60.16 103.5,62.7 IC2.4 | v88.26,66.51 IC1.13 | v14.6,51.27 13.33,50 v13.33,41.11 | v89.53,60.16 86.99,57.62 v86.99,37.3 | v65.4,51.27 v65.4,36.03 | U$1.29 v43.81,53.81
  Bottom 0.254: v88.26,66.51 86.99,66.51 86.99,61.43 88.26,61.43 v89.53,60.16 v100.96,60.16 | v14.6,51.27 42.54,51.27 43.81,50 U$1.29 | v13.33,41.11 12.06,39.84 5.71,39.84 U$2.19 | v86.99,37.3 85.72,36.03 v65.4,36.03 | v65.4,51.27 62.86,53.81 v43.81,53.81
ADDR5  (via drill 0.61)
  Top 0.254: v89.53,61.43 89.53,66.51 90.8,67.78 IC1.14 | 46.35,32.22 43.81,29.68 43.81,18.25 42.54,16.98 42.54,6.82 v41.27,5.55 | 46.35,32.22 U$1.30 | v107.31,42.38 107.31,61.43 106.04,62.7 IC2.3 | v90.8,39.84 85.72,34.76 v85.72,28.41 | v69.21,20.79 v71.75,23.33 | v48.89,20.79 46.35,23.33 46.35,32.22
  Bottom 0.254: v89.53,61.43 104.77,61.43 106.04,62.7 IC2.3 | v41.27,5.55 8.25,5.55 1.9,11.9 1.9,36.03 5.71,36.03 U$2.20 | v107.31,42.38 104.77,42.38 103.5,41.11 99.69,41.11 98.42,39.84 v90.8,39.84 | v85.72,28.41 80.64,23.33 v71.75,23.33 | v48.89,20.79 v69.21,20.79
ADDR6  (via drill 0.61)
  Top 0.254: v98.42,66.51 IC1.17 | v46.35,51.27 46.35,55.08 v42.54,58.89 | v27.3,58.89 24.76,56.35 24.76,46.19 v23.49,46.19 | v20.95,41.11 v20.95,44.92 | v90.8,41.11 v90.8,46.19 | v50.16,33.49 v50.16,39.84 | v108.58,52.54 IC2.2
  Bottom 0.254: v98.42,66.51 107.31,66.51 108.58,65.24 IC2.2 | v46.35,51.27 47.62,51.27 48.89,50 U$1.31 | v27.3,58.89 v42.54,58.89 | v23.49,46.19 22.22,44.92 v20.95,44.92 | v20.95,41.11 18.41,38.57 8.25,38.57 6.98,37.3 6.98,34.76 5.71,34.76 U$2.21 5.71,33.49 v50.16,33.49 | v108.58,52.54 107.31,51.27 107.31,46.19 v90.8,46.19 | v90.8,41.11 89.53,39.84 v50.16,39.84
ADDR7  (via drill 0.61)
  Top 0.254: v102.23,60.16 100.96,58.89 99.69,58.89 99.69,66.51 100.96,67.78 IC1.18 | v51.43,33.49 U$1.32 | v112.39,28.41 112.39,51.27 111.12,52.54 IC2.1 | v106.04,25.87 104.77,24.6 102.23,24.6 v102.23,32.22
  Bottom 0.254: v102.23,60.16 108.58,60.16 111.12,62.7 IC2.1 | 50.16,32.22 v51.43,33.49 | 50.16,32.22 5.71,32.22 U$2.22 | v112.39,28.41 109.85,25.87 v106.04,25.87 | v102.23,32.22 100.96,33.49 70.48,33.49 69.21,32.22 50.16,32.22
ADDR8
  Top 0.254: IC2.23 108.58,50 109.85,51.27 109.85,70.32 103.5,76.67 IC1.2
ADDR9  (via drill 0.61)
  Top 0.254: v80.64,53.81 v80.64,74.13 | v95.88,74.13 IC1.5
  Bottom 0.254: v80.64,53.81 106.04,53.81 IC2.22 | v80.64,74.13 v95.88,74.13
ADDR10
  Top 0.254: IC2.19 98.42,57.62 94.61,61.43 94.61,75.4 93.34,76.67 IC1.6
ADDR11  (via drill 0.61)
  Top 0.254: v71.75,51.27 71.75,60.16 73.02,61.43 v73.02,75.4
  Bottom 0.254: v71.75,51.27 73.02,51.27 74.29,50 80.64,50 83.18,52.54 103.5,52.54 IC2.21 | v73.02,75.4 84.45,75.4 85.72,76.67 IC1.9
ADDR12  (via drill 0.61)
  Top 0.254: v86.99,83.02 86.99,75.4 85.72,74.13 IC1.12 | v112.39,83.02 117.47,77.94 v117.47,39.84
  Bottom 0.254: v112.39,83.02 v86.99,83.02 | v117.47,39.84 114.93,37.3 108.58,37.3 IC9.1
ADDR13  (via drill 0.61)
  Top 0.254: v102.23,51.27 v102.23,38.57 | v85.72,51.27 85.72,60.16 86.99,61.43 86.99,72.86 89.53,72.86 v89.53,67.78
  Bottom 0.254: v102.23,38.57 104.77,38.57 106.04,37.3 IC9.2 | v85.72,51.27 v102.23,51.27 | v89.53,67.78 92.07,67.78 93.34,69.05 IC1.15
ADDR14  (via drill 0.61)
  Top 0.254: v104.77,57.62 104.77,46.19 103.5,44.92 IC9.3 | v112.39,57.62 112.39,66.51 111.12,67.78 111.12,84.29 106.04,89.37 106.04,93.18 104.77,94.45 102.23,94.45 102.23,85.56 97.15,80.48 97.15,74.13 95.88,72.86 IC1.16
  Bottom 0.254: v104.77,57.62 v112.39,57.62
ADDR15  (via drill 0.61)
  Top 0.254: v113.66,67.78 116.2,65.24 v116.2,62.7
  Bottom 0.254: v113.66,67.78 104.77,67.78 103.5,69.05 IC1.19 | v116.2,62.7 SV2.1 121.28,57.62 123.82,57.62 123.82,55.08 SV2.6
CLEAR  (via drill 0.61)
  Top 0.254: IC4.9 IC4.6 18.41,30.95 20.95,33.49 v20.95,34.76 | v69.21,74.13 69.21,67.78 66.67,65.24 U$1.3 | v83.18,72.86 84.45,74.13 84.45,80.48 v85.72,81.75 | v56.51,34.76 v56.51,14.44 | v73.02,14.44 v83.18,4.28
  Bottom 0.254: 85.72,4.28 85.72,5.55 SV6.7 | 85.72,4.28 85.72,1.74 139.06,1.74 139.06,38.57 LED3.A 137.79,43.65 137.79,69.05 125.09,81.75 v85.72,81.75 | v69.21,74.13 79.37,74.13 80.64,72.86 v83.18,72.86 | v20.95,34.76 v56.51,34.76 | v56.51,14.44 v73.02,14.44 | v83.18,4.28 85.72,4.28
DATA0  (via drill 0.61)
  Top 0.254: v14.6,81.75 18.41,77.94 v18.41,66.51
  Bottom 0.254: 37.46,66.51 38.73,67.78 88.26,67.78 90.8,65.24 IC2.9 | 37.46,66.51 36.19,65.24 U$1.15 | v14.6,81.75 5.71,81.75 U$2.2 | v18.41,66.51 37.46,66.51
DATA1  (via drill 0.61)
  Top 0.254: v41.27,60.16 38.73,62.7 U$1.14 38.73,65.24 v36.19,67.78 | v86.99,60.16 88.26,61.43 IC2.10 | v12.06,69.05 12.06,76.67 9.52,79.21 9.52,88.1 8.25,88.1 6.98,86.83 6.98,80.48 5.71,80.48 U$2.3
  Bottom 0.254: v41.27,60.16 v86.99,60.16 | v12.06,69.05 13.33,67.78 v36.19,67.78
DATA2  (via drill 0.61)
  Top 0.254: v37.46,69.05 41.27,65.24 U$1.13
  Bottom 0.254: U$1.13 41.27,65.24 42.54,66.51 84.45,66.51 85.72,65.24 IC2.11 | v37.46,69.05 22.22,69.05 20.95,70.32 9.52,70.32 9.52,71.59 10.79,72.86 15.87,72.86 15.87,74.13 14.6,75.4 8.25,75.4 6.98,76.67 5.71,76.67 U$2.4
DATA3  (via drill 0.61)
  Top 0.254: v45.08,58.89 45.08,61.43 43.81,62.7 U$1.12 | v83.18,57.62 IC2.13 | v14.6,74.13 15.87,72.86 v15.87,57.62
  Bottom 0.254: v83.18,57.62 76.83,57.62 75.56,58.89 v45.08,58.89 43.81,57.62 v15.87,57.62 | v14.6,74.13 5.71,74.13 U$2.5
DATA4  (via drill 0.61)
  Top 0.254: v84.45,56.35 84.45,51.27 85.72,50 IC2.14 | v46.35,57.62 U$1.11 | v14.6,57.62 v14.6,65.24
  Bottom 0.254: v84.45,56.35 76.83,56.35 75.56,57.62 v46.35,57.62 45.08,56.35 15.87,56.35 v14.6,57.62 | v14.6,65.24 13.33,65.24 6.98,71.59 5.71,71.59 U$2.6
DATA5  (via drill 0.61)
  Top 0.254: v48.89,56.35 U$1.10 48.89,70.32 v42.54,76.67 | v88.26,55.08 IC2.15 | v9.52,77.94 9.52,76.67 8.25,75.4 8.25,70.32 5.71,70.32 U$2.7 | v31.11,79.21 32.38,77.94 40,77.94 v40,76.67
  Bottom 0.254: v48.89,56.35 74.29,56.35 76.83,53.81 79.37,53.81 80.64,55.08 v88.26,55.08 | v9.52,77.94 10.79,79.21 v31.11,79.21 | v40,76.67 v42.54,76.67
DATA6  (via drill 0.61)
  Top 0.254: v53.97,55.08 53.97,60.16 51.43,62.7 U$1.9 | v8.25,37.3 v8.25,66.51 | v20.95,37.3 v22.22,36.03 | v45.08,36.03 v45.08,55.08
  Bottom 0.254: IC2.16 90.8,47.46 89.53,46.19 67.94,46.19 67.94,51.27 64.13,55.08 v53.97,55.08 v45.08,55.08 | v8.25,66.51 5.71,66.51 U$2.8 | v8.25,37.3 v20.95,37.3 | v22.22,36.03 v45.08,36.03
DATA7  (via drill 0.61)
  Top 0.254: v93.34,44.92 IC2.17 | U$1.8 53.97,62.7 55.24,61.43 v55.24,44.92 55.24,34.76 v50.16,29.68 | v12.06,14.44 v12.06,58.89 | v33.65,10.63 33.65,16.98 34.92,18.25 v34.92,29.68
  Bottom 0.254: v55.24,44.92 v93.34,44.92 | v12.06,58.89 6.98,63.97 5.71,63.97 U$2.9 | v12.06,14.44 15.87,10.63 v33.65,10.63 | v34.92,29.68 v50.16,29.68
DMA_IN  (via drill 0.61)
  Top 0.254: v50.16,46.19 48.89,44.92 v48.89,38.57 | 19.68,39.84 17.14,42.38 R12.1 | 19.68,39.84 v20.95,38.57 | SV6.5 89.53,9.36 86.99,11.9 v86.99,14.44 | v71.75,15.71 71.75,8.09 69.21,5.55 46.35,5.55 v46.35,16.98 | v33.65,18.25 29.84,18.25 29.84,24.6 27.3,27.14 24.76,27.14 24.76,32.22 19.68,37.3 19.68,39.84
  Bottom 0.254: v50.16,46.19 65.4,46.19 66.67,47.46 U$1.38 | v20.95,38.57 v48.89,38.57 | v86.99,14.44 74.29,14.44 73.02,15.71 v71.75,15.71 | v46.35,16.98 45.08,18.25 v33.65,18.25
DMA_OUT  (via drill 0.61)
  Top 0.254: v33.65,30.95 33.65,41.11 31.11,43.65 31.11,44.92 29.84,46.19 29.84,53.81 27.3,56.35 26.03,56.35 v26.03,55.08 | U$1.37 v64.13,30.95 v64.13,13.17 | v137.79,89.37 139.06,88.1 139.06,20.79 v135.25,16.98 | v90.8,11.9 88.26,11.9 v88.26,13.17
  Bottom 0.254: v33.65,30.95 v64.13,30.95 | v26.03,55.08 22.22,55.08 20.95,53.81 18.41,53.81 R11.1 | SV3.6 99.69,91.91 123.82,91.91 126.36,89.37 v137.79,89.37 | v135.25,16.98 130.17,11.9 v90.8,11.9 | v64.13,13.17 v88.26,13.17
EF1  (via drill 0.61)
  Top 0.254: v36.19,46.19 JP2.2 | JP1.2 v23.49,44.92 | v29.84,74.13 29.84,55.08 31.11,53.81 U$1.24
  Bottom 0.254: JP3.2 24.76,74.13 v29.84,74.13 34.92,74.13 JP4.2 | 32.38,46.19 31.11,47.46 U$1.24 | 32.38,46.19 v36.19,46.19 | v23.49,44.92 24.76,46.19 32.38,46.19
EF2  (via drill 0.61)
  Top 0.254: v26.03,76.67 JP3.4 | 36.19,75.4 JP4.4 | 36.19,75.4 v34.92,76.67 | 29.84,38.57 29.84,44.92 28.57,46.19 U$1.23 | 29.84,38.57 26.03,38.57 JP1.4 | JP2.4 37.46,38.57 37.46,33.49 34.92,30.95 | 34.92,30.95 33.65,29.68 32.38,29.68 32.38,33.49 29.84,36.03 29.84,38.57 | 36.19,75.4 34.92,74.13 34.92,30.95
  Bottom 0.254: v34.92,76.67 v26.03,76.67
EF3  (via drill 0.61)
  Top 0.254: JP3.6 v28.57,77.94 | v41.27,77.94 JP4.6 | JP1.6 v28.57,43.65 | v26.03,43.65 U$1.22 | JP2.6 40,41.11 v40,43.65 | v32.38,43.65 v32.38,71.59
  Bottom 0.254: v28.57,77.94 v41.27,77.94 | v26.03,43.65 v28.57,43.65 v32.38,43.65 v40,43.65 | JP3.6 29.84,71.59 v32.38,71.59
EF4  (via drill 0.61)
  Top 0.254: JP3.8 31.11,76.67 28.57,79.21 27.3,79.21 22.22,74.13 22.22,61.43 23.49,60.16 U$1.21 23.49,47.46 22.22,46.19 v22.22,41.11 | JP4.8 42.54,71.59 42.54,60.16 37.46,55.08 v37.46,41.11
  Bottom 0.254: 32.38,41.11 JP1.8 | 32.38,41.11 v37.46,41.11 42.54,41.11 JP2.8 | v22.22,41.11 32.38,41.11
FEF  (via drill 0.61)
  Top 0.254: JP2.3 JP2.5 JP2.7 | SV6.1 93.34,4.28 90.8,4.28 90.8,9.36 v89.53,10.63 | v66.67,19.52 v66.67,10.63 | v51.43,19.52 48.89,22.06 v48.89,36.03
  Bottom 0.254: JP2.3 JP2.1 | v66.67,10.63 v89.53,10.63 | v51.43,19.52 v66.67,19.52 | v48.89,36.03 47.62,37.3 JP2.7
GND  (via drill 0.61)
  Top 0.254: SV5.5 52.7,83.02 53.97,84.29 C2.2 | C14.- v13.33,63.97 | C13.2 76.83,56.35 76.83,60.16 C8.2 78.1,62.7 v79.37,63.97 78.1,65.24 v78.1,83.02 | IC1.10 83.18,81.75 C9.2 84.45,85.56 84.45,91.91 SV3.15 SV3.13 SV3.11 SV3.9 SV3.7 SV3.5 | SV3.1 104.77,91.91 104.77,80.48 106.04,79.21 IC1.1 | IC8.7 61.59,86.83 64.13,84.29 67.94,84.29 67.94,83.02 69.21,81.75 IC8.11 | 128.9,15.71 R18.1 R17.1 128.9,57.62 v127.63,58.89 | 128.9,15.71 R14.1 | 128.9,15.71 116.2,3.01 S1.4 | C4.2 36.19,14.44 37.46,15.71 37.46,25.87 C3.2 | IC4.7 15.87,28.41 14.6,27.14 14.6,18.25 15.87,16.98 IC3.7 15.87,11.9 5.71,11.9 U$2.30 | 97.15,19.52 98.42,18.25 IC6.11 98.42,3.01 SV6.2 | 97.15,19.52 95.88,20.79 IC6.5 | 97.15,19.52 97.15,30.95 98.42,32.22 IC9.5 | U1.4 67.94,37.3 IC5.1 74.29,24.6 74.29,19.52 C5.2 | 62.86,37.3 C12.2 | 62.86,37.3 v62.86,38.57 | IC9.8 90.8,34.76 89.53,33.49 89.53,24.6 90.8,23.33 IC6.7 | 62.86,37.3 62.86,32.22 61.59,30.95 61.59,14.44 59.05,11.9 56.51,11.9 53.97,14.44 53.97,19.52 50.16,23.33 IC5.8 | v111.12,85.56 118.74,77.94 118.74,37.3 C7.2
  Bottom 0.254: IC8.7 55.24,88.1 C2.2 51.43,86.83 50.16,85.56 32.38,85.56 | 32.38,85.56 C10.2 | 32.38,85.56 33.65,86.83 IC7.7 C14.- | v13.33,63.97 U$1.20 | v79.37,63.97 IC2.12 | IC8.11 IC8.12 71.75,81.75 73.02,83.02 v78.1,83.02 C9.2 84.45,85.56 v111.12,85.56 | C11.2 111.12,76.67 106.04,76.67 IC1.1 | SV3.5 SV3.3 SV3.1 | R18.1 113.66,20.79 C6.2 111.12,18.25 95.88,18.25 94.61,19.52 | C7.2 120.01,38.57 123.82,38.57 128.9,43.65 R17.1 | v127.63,58.89 SV2.2 | IC5.8 38.73,24.6 C3.2 17.14,27.14 15.87,28.41 IC4.7 | v62.86,38.57 U1.4 | 79.37,19.52 80.64,20.79 90.8,20.79 IC6.7 | C5.2 79.37,19.52 | 94.61,19.52 95.88,20.79 IC6.5 | 79.37,19.52 94.61,19.52
KEF  (via drill 0.61)
  Top 0.254: JP4.1 JP4.3 JP4.5 | v88.26,80.48 SV3.14 | v74.29,72.86 v74.29,76.67
  Bottom 0.254: JP4.5 JP4.7 45.08,69.05 59.05,69.05 60.32,70.32 71.75,70.32 v74.29,72.86 | v88.26,80.48 81.91,80.48 78.1,76.67 v74.29,76.67
LCLK  (via drill 0.61)
  Top 0.254: v92.07,86.83 SV3.8
  Bottom 0.254: 73.02,85.56 65.4,85.56 64.13,86.83 IC8.6 | 73.02,85.56 74.29,86.83 IC8.2 | v92.07,86.83 79.37,86.83 78.1,85.56 73.02,85.56
N0  (via drill 0.61)
  Top 0.254: v24.76,71.59 24.76,66.51 26.03,65.24 U$1.19 | v10.79,71.59 6.98,67.78 6.98,24.6 8.25,23.33 v8.25,15.71
  Bottom 0.254: v10.79,71.59 v24.76,71.59 | v8.25,15.71 6.98,14.44 5.71,14.44 U$2.29
N1  (via drill 0.61)
  Top 0.254: v27.3,77.94 27.3,66.51 28.57,65.24 U$1.18 | v8.25,86.83 v8.25,76.67 | v3.17,18.25 v3.17,86.83
  Bottom 0.254: v27.3,77.94 10.79,77.94 9.52,76.67 v8.25,76.67 | v3.17,86.83 v8.25,86.83 | v3.17,18.25 4.44,16.98 5.71,16.98 U$2.28
N2  (via drill 0.61)
  Top 0.254: v13.33,61.43 10.79,58.89 v10.79,27.14
  Bottom 0.254: v13.33,61.43 29.84,61.43 31.11,62.7 U$1.17 | v10.79,27.14 5.71,27.14 U$2.24
N$1  (via drill 0.61)
  Top 0.254: v53.97,76.67 55.24,75.4 SV5.3
  Bottom 0.254: v53.97,76.67 43.81,76.67 41.27,79.21 IC7.11
N$2  (via drill 0.61)
  Top 0.254: R6.1 76.83,33.49 76.83,29.68 75.56,28.41 | 75.56,28.41 73.02,28.41 73.02,34.76 74.29,36.03 U1.1 | v137.79,38.57 137.79,88.1 133.98,91.91 SV1.1 | 75.56,28.41 81.91,22.06 v81.91,9.36
  Bottom 0.254: 137.79,10.63 v137.79,38.57 | 137.79,10.63 137.79,9.36 135.25,6.82 117.47,6.82 116.2,8.09 S1.2 | v81.91,9.36 104.77,9.36 106.04,10.63 137.79,10.63
N$3  (via drill 0.61)
  Top 0.254: v99.69,32.22 99.69,24.6 98.42,23.33 IC6.4 | R13.1 v79.37,32.22 | v97.15,32.22 97.15,41.11 95.88,42.38 IC2.18
  Bottom 0.254: v79.37,32.22 v97.15,32.22 v99.69,32.22
N$4
  Bottom 0.254: IC7.13 46.35,79.21 47.62,77.94 62.86,77.94 64.13,79.21 IC8.9
N$5
  Top 0.254: LED1.K 131.44,5.55 132.71,4.28 136.52,4.28 R14.2
N$6  (via drill 0.61)
  Top 0.254: SV5.1 v57.78,79.21
  Bottom 0.254: v57.78,79.21 61.59,79.21 IC8.8
N$7
  Top 0.254: LED4.K 131.44,56.35 130.17,55.08 130.17,1.74 106.04,1.74 103.5,4.28 103.5,10.63 100.96,13.17 IC6.12
N$8
  Bottom 0.254: LED4.A 133.98,66.51 R15.2
N$9
  Bottom 0.254: LED3.K R17.2
N$10
  Bottom 0.254: LED2.K R18.2
N$13
  Top 0.254: R16.2 133.98,76.67 LED5.A
N$15  (via drill 0.61)
  Top 0.254: v107.31,30.95 107.31,24.6 106.04,23.33 IC6.1
  Bottom 0.254: v107.31,30.95 81.91,30.95 79.37,28.41 64.13,28.41 62.86,27.14 61.59,27.14 60.32,25.87 IC5.4
N$16  (via drill 0.61)
  Top 0.254: IC7.1 IC7.2 46.35,86.83 43.81,84.29 v43.81,83.02 | R9.2 17.14,84.29 R8.1
  Bottom 0.254: R9.2 20.95,80.48 IC7.8 33.65,81.75 34.92,83.02 v43.81,83.02
N$17
  Top 0.254: R5.1 IC5.15
  Bottom 0.254: C1.+ 55.24,9.36 R5.1
N$18
  Top 0.254: IC7.3 IC7.4 IC7.5 38.73,86.83 37.46,85.56 34.92,85.56 34.92,90.64 26.03,90.64 26.03,83.02 24.76,81.75 Q1.2
  Bottom 0.254: R9.1 18.41,83.02 23.49,83.02 24.76,81.75 Q1.2
N$19
  Top 0.254: C1.- 51.43,9.36 57.78,9.36 62.86,14.44 IC5.14
N$20  (via drill 0.61)
  Top 0.254: v99.69,55.08 99.69,43.65 100.96,42.38 IC9.4
  Bottom 0.254: v99.69,55.08 121.28,55.08 SV2.4
N$21  (via drill 0.61)
  Top 0.254: IC7.10 IC7.9 36.19,81.75 34.92,83.02 31.11,83.02 v31.11,86.83
  Bottom 0.254: R8.2 24.76,86.83 | 24.76,86.83 v31.11,86.83 | 24.76,86.83 Q1.1
N$22
  Top 0.254: IC3.8 15.87,9.36 17.14,10.63 17.14,18.25 20.95,18.25 IC3.5
N$23  (via drill 0.61)
  Top 0.254: v51.43,85.56 51.43,90.64 37.46,90.64 36.19,89.37 IC7.6 | v61.59,85.56 64.13,83.02 65.4,83.02 65.4,77.94 66.67,76.67 73.02,76.67 73.02,85.56 71.75,86.83 IC8.3
  Bottom 0.254: v51.43,85.56 v61.59,85.56
N$24
  Top 0.254: IC4.8 15.87,20.79 17.14,19.52 19.68,19.52 19.68,27.14 20.95,28.41 IC4.5
N$25  (via drill 0.61)
  Top 0.254: v86.99,23.33 86.99,19.52 90.8,15.71 IC6.8 | v133.98,41.11 135.25,42.38 135.25,74.13 131.44,77.94 LED5.K
  Bottom 0.254: v86.99,23.33 89.53,25.87 98.42,25.87 99.69,24.6 117.47,24.6 v133.98,41.11
N$27  (via drill 0.61)
  Top 0.254: v70.48,71.59 70.48,66.51 71.75,65.24 U$1.1 | v56.51,76.67 53.97,79.21 R10.1 56.51,84.29 C2.1 56.51,90.64 65.4,90.64 66.67,89.37 IC8.5
  Bottom 0.254: v70.48,71.59 65.4,76.67 v56.51,76.67
N$29  (via drill 0.61)
  Top 0.254: v123.82,32.22 126.36,34.76 v126.36,60.16 | IC9.15 v106.04,32.22
  Bottom 0.254: v106.04,32.22 v123.82,32.22 | v126.36,60.16 123.82,62.7 SV4.16
N$30  (via drill 0.61)
  Top 0.254: v123.82,39.84 125.09,41.11 v125.09,63.97 | IC9.14 v103.5,32.22
  Bottom 0.254: v103.5,32.22 104.77,33.49 112.39,33.49 118.74,39.84 v123.82,39.84 | v125.09,63.97 123.82,65.24 SV4.14
N$31  (via drill 0.61)
  Top 0.254: v99.69,38.57 99.69,33.49 100.96,32.22 IC9.13 | v113.66,39.84 v113.66,61.43
  Bottom 0.254: v99.69,38.57 100.96,39.84 v113.66,39.84 | v113.66,61.43 118.74,66.51 121.28,66.51 SV4.12
N$32  (via drill 0.61)
  Top 0.254: v104.77,25.87 v104.77,41.11 | v123.82,41.11 123.82,69.05 SV4.10
  Bottom 0.254: v104.77,25.87 99.69,25.87 98.42,27.14 IC9.12 | v104.77,41.11 v123.82,41.11
N$33  (via drill 0.61)
  Top 0.254: v92.07,55.08 92.07,43.65 94.61,41.11 94.61,30.95 95.88,29.68 IC9.11
  Bottom 0.254: v92.07,55.08 95.88,58.89 109.85,58.89 118.74,67.78 118.74,71.59 121.28,71.59 SV4.8
N$34  (via drill 0.61)
  Top 0.254: v97.15,6.82 97.15,16.98 94.61,19.52 94.61,25.87 93.34,27.14 IC9.10 | v106.04,6.82 106.04,8.09 122.55,24.6 v122.55,51.27
  Bottom 0.254: v97.15,6.82 v106.04,6.82 | v122.55,51.27 130.17,58.89 130.17,75.4 SV4.6
N$35  (via drill 0.61)
  Top 0.254: v92.07,38.57 92.07,30.95 90.8,29.68 IC9.9 | v98.42,38.57 99.69,39.84 v99.69,42.38 | v120.01,43.65 121.28,44.92 121.28,76.67 SV4.4
  Bottom 0.254: v92.07,38.57 v98.42,38.57 | v99.69,42.38 103.5,42.38 104.77,43.65 v120.01,43.65
N$36  (via drill 0.61)
  Top 0.254: v98.42,41.11 v98.42,44.92 | v130.17,56.35 130.17,62.7 125.09,67.78 125.09,77.94 SV4.2 | IC9.7 v93.34,41.11
  Bottom 0.254: v93.34,41.11 v98.42,41.11 | v98.42,44.92 118.74,44.92 v130.17,56.35
N$37  (via drill 0.61)
  Top 0.254: SV4.15 SV4.13 SV4.11 SV4.9 SV4.7 SV4.5 SV4.3 SV4.1 108.58,91.91 v108.58,93.18 | v79.37,91.91 78.1,90.64 70.48,90.64 70.48,77.94 66.67,77.94 IC8.10
  Bottom 0.254: IC7.12 43.81,81.75 45.08,83.02 65.4,83.02 66.67,81.75 IC8.10 | v108.58,93.18 107.31,94.45 81.91,94.45 v79.37,91.91
N$38  (via drill 0.61)
  Top 0.254: v94.61,55.08 94.61,42.38 95.88,41.11 IC9.6
  Bottom 0.254: v94.61,55.08 95.88,56.35 SV2.3
Q  (via drill 0.61)
  Top 0.254: v79.37,18.25 79.37,20.79 70.48,29.68 70.48,39.84 67.94,42.38 67.94,58.89 64.13,62.7 U$1.4 64.13,71.59 v61.59,74.13 | v85.72,15.71 85.72,1.74 99.69,1.74 99.69,16.98 103.5,16.98 IC6.13 | v46.35,74.13 42.54,77.94 42.54,84.29 33.65,84.29 32.38,85.56 32.38,88.1 29.84,88.1 28.57,86.83 28.57,80.48 23.49,80.48 23.49,89.37 6.98,89.37 4.44,86.83 4.44,62.7 5.71,62.7 U$2.10
  Bottom 0.254: v79.37,18.25 81.91,15.71 v85.72,15.71 | v46.35,74.13 v61.59,74.13
SC0  (via drill 0.61)
  Top 0.254: v64.13,77.94 60.32,74.13 60.32,66.51 59.05,65.24 U$1.6
  Bottom 0.254: v64.13,77.94 78.1,77.94 81.91,81.75 84.45,81.75 86.99,84.29 111.12,84.29 112.39,85.56 112.39,90.64 SV3.2
SC1  (via drill 0.61)
  Top 0.254: v79.37,72.86 79.37,89.37 84.45,94.45 99.69,94.45 99.69,91.91 SV3.4 | v61.59,69.05 U$1.5 | SV6.3 92.07,16.98 88.26,20.79 v88.26,36.03 | v78.1,38.57 75.56,41.11 75.56,60.16 76.83,61.43 v76.83,70.32
  Bottom 0.254: v61.59,69.05 73.02,69.05 75.56,71.59 | 75.56,71.59 76.83,72.86 v79.37,72.86 | v88.26,36.03 88.26,38.57 v78.1,38.57 | v76.83,70.32 75.56,71.59
TPA  (via drill 0.61)
  Top 0.254: U1.7 v71.75,34.76 73.02,36.03 73.02,60.16 74.29,61.43 v74.29,69.05 | U$1.34 v56.51,37.3 57.78,36.03 v57.78,28.41 | v9.52,28.41 v9.52,58.89 | v38.73,23.33 40,24.6 v40,25.87
  Bottom 0.254: v56.51,37.3 59.05,34.76 v71.75,34.76 | v74.29,69.05 83.18,69.05 IC1.11 | v9.52,58.89 5.71,58.89 U$2.11 | v9.52,28.41 13.33,28.41 15.87,25.87 32.38,25.87 34.92,23.33 v38.73,23.33 | v40,25.87 41.27,27.14 47.62,27.14 48.89,28.41 v57.78,28.41
TPB  (via drill 0.61)
  Top 0.254: v59.05,89.37 59.05,69.05 52.7,69.05 50.16,66.51 50.16,53.81 53.97,50 U$1.33
  Bottom 0.254: v59.05,89.37 51.43,89.37 50.16,90.64 5.71,90.64 1.9,86.83 1.9,57.62 5.71,57.62 U$2.12
VCC  (via drill 0.61)
  Top 0.254: R12.2 R11.2 R7.2 19.68,79.21 20.95,80.48 v20.95,84.29 | C10.1 29.84,79.21 33.65,75.4 U$1.16 | U1.2 U$1.40 | IC8.14 v76.83,84.29 IC8.1 | R13.2 80.64,28.41 v80.64,30.95 R6.2 80.64,50 79.37,51.27 | C13.1 79.37,51.27 | C8.1 79.37,57.62 79.37,51.27 | C9.1 80.64,84.29 80.64,75.4 81.91,74.13 81.91,53.81 79.37,51.27 | v69.21,84.29 IC8.4 | R10.2 57.78,83.02 v57.78,84.29 | R16.1 R15.1 | 113.66,18.25 114.93,19.52 C7.1 | C6.1 113.66,18.25 | IC2.24 111.12,47.46 109.85,46.19 109.85,30.95 108.58,29.68 IC9.16 | C11.1 112.39,67.78 114.93,65.24 114.93,36.03 113.66,34.76 113.66,18.25 | C3.1 36.19,15.71 34.92,14.44 34.92,11.9 C4.1 | R1.2 R2.2 45.08,15.71 R3.2 R4.2 | R5.2 IC5.16 67.94,20.79 65.4,23.33 IC5.2 v65.4,33.49 | v106.04,9.36 IC6.14 | v69.21,33.49 U1.3
  Bottom 0.254: U$2.1 5.71,85.56 8.25,85.56 C14.+ 14.6,84.29 v20.95,84.29 28.57,84.29 C10.1 31.11,84.29 v57.78,84.29 v69.21,84.29 v76.83,84.29 80.64,84.29 C9.1 | U1.3 U1.2 | IC7.14 55.24,80.48 R10.2 | v80.64,30.95 U1.8 | C13.1 76.83,52.54 74.29,55.08 69.21,55.08 69.21,52.54 71.75,50 U$1.40 | IC1.20 106.04,71.59 107.31,72.86 C11.1 113.66,74.13 R16.1 | SV2.5 114.93,53.81 111.12,50 IC2.24 | C6.1 107.31,16.98 106.04,15.71 IC6.14 | C7.1 109.85,30.95 108.58,29.68 IC9.16 | IC3.14 31.11,9.36 34.92,9.36 C4.1 37.46,9.36 42.54,9.36 R1.2 69.21,8.09 | R3.2 43.81,20.79 31.11,20.79 IC4.14 | LED1.A 132.71,9.36 v106.04,9.36 104.77,8.09 69.21,8.09 | 69.21,8.09 R5.2 | C5.1 75.56,18.25 67.94,18.25 IC5.16 | C12.1 v65.4,33.49 v69.21,33.49
VEF  (via drill 0.61)
  Top 0.254: SV3.16 86.99,91.91 89.53,91.91 89.53,74.13 v90.8,72.86 | v104.77,72.86 104.77,61.43 v100.96,57.62 | v97.15,42.38 v97.15,57.62 | v62.86,71.59 v62.86,42.38
  Bottom 0.254: JP3.1 JP3.3 JP3.5 JP3.7 32.38,70.32 33.65,71.59 v62.86,71.59 | v104.77,72.86 v90.8,72.86 | v97.15,57.62 v100.96,57.62 | v62.86,42.38 v97.15,42.38
WAIT  (via drill 0.61)
  Top 0.254: IC3.9 18.41,11.9 | 18.41,11.9 IC3.6 | v106.04,16.98 v111.12,22.06 | SV6.9 v84.45,18.25 83.18,19.52 83.18,28.41 81.91,29.68 81.91,50 v80.64,51.27 | v70.48,53.81 70.48,61.43 69.21,62.7 U$1.2 | 18.41,11.9 v19.68,11.9 | v29.84,13.17 33.65,9.36 v33.65,8.09
  Bottom 0.254: LED2.A 132.71,27.14 121.28,27.14 116.2,22.06 v111.12,22.06 | v106.04,16.98 95.88,16.98 94.61,18.25 v84.45,18.25 | v70.48,53.81 71.75,52.54 75.56,52.54 76.83,51.27 v80.64,51.27 | v19.68,11.9 23.49,11.9 24.76,13.17 v29.84,13.17 | v33.65,8.09 34.92,6.82 41.27,6.82 42.54,5.55 SV6.9

### Text on the board
tNames: ROM BANK 7-0 | Ext Reset | Video/Keyboard | VMA | No ROM | Boot/Remap | Boot Only | VMA | VID EF | KB EF | Q | H-A15-L | CLEAR | BUS EF | FP EF | WAIT | PWR | Front Panel | RESET